# EasyEDA Pro project HEMY-2R-board.epro, board HEMY Redux v2.6.5M
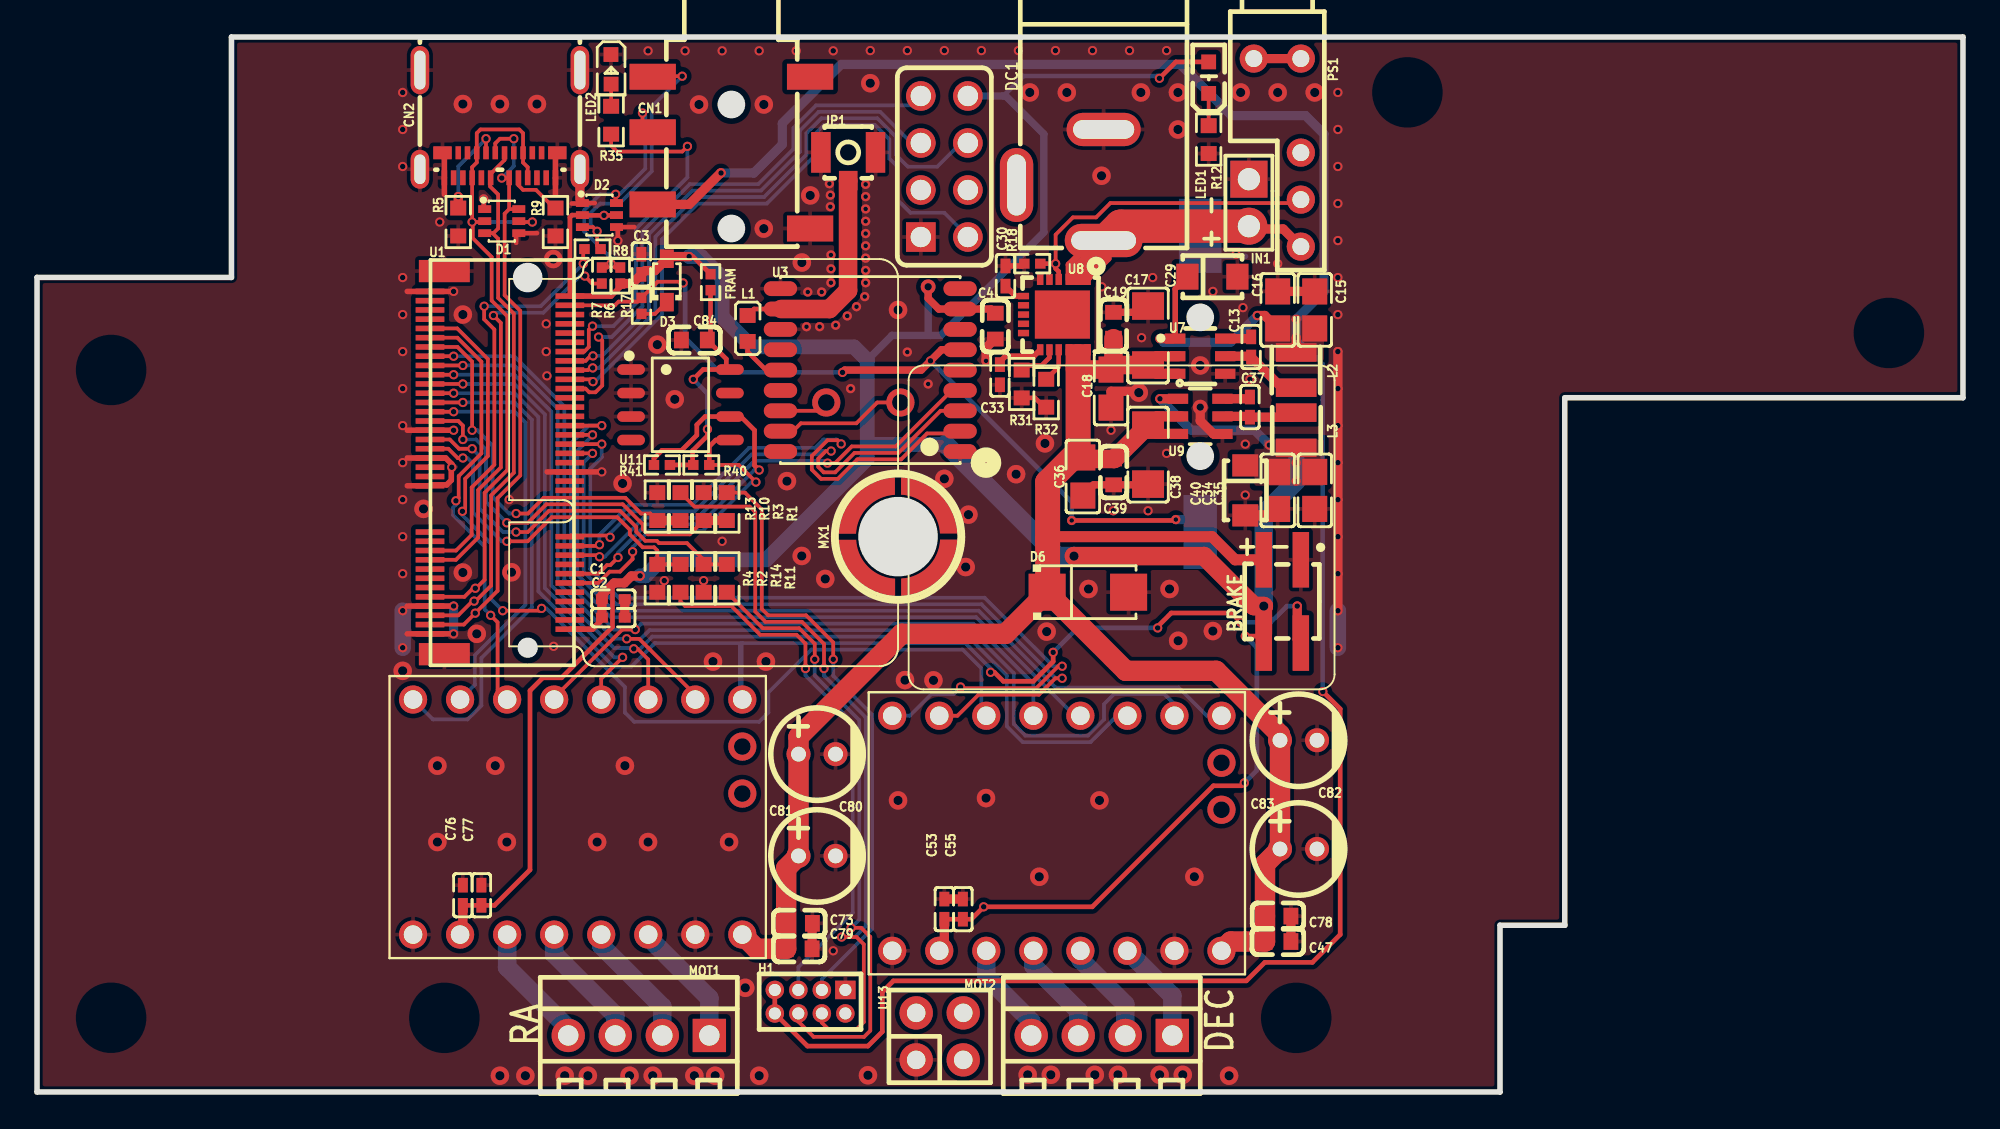
[diagram p7: board, top side]
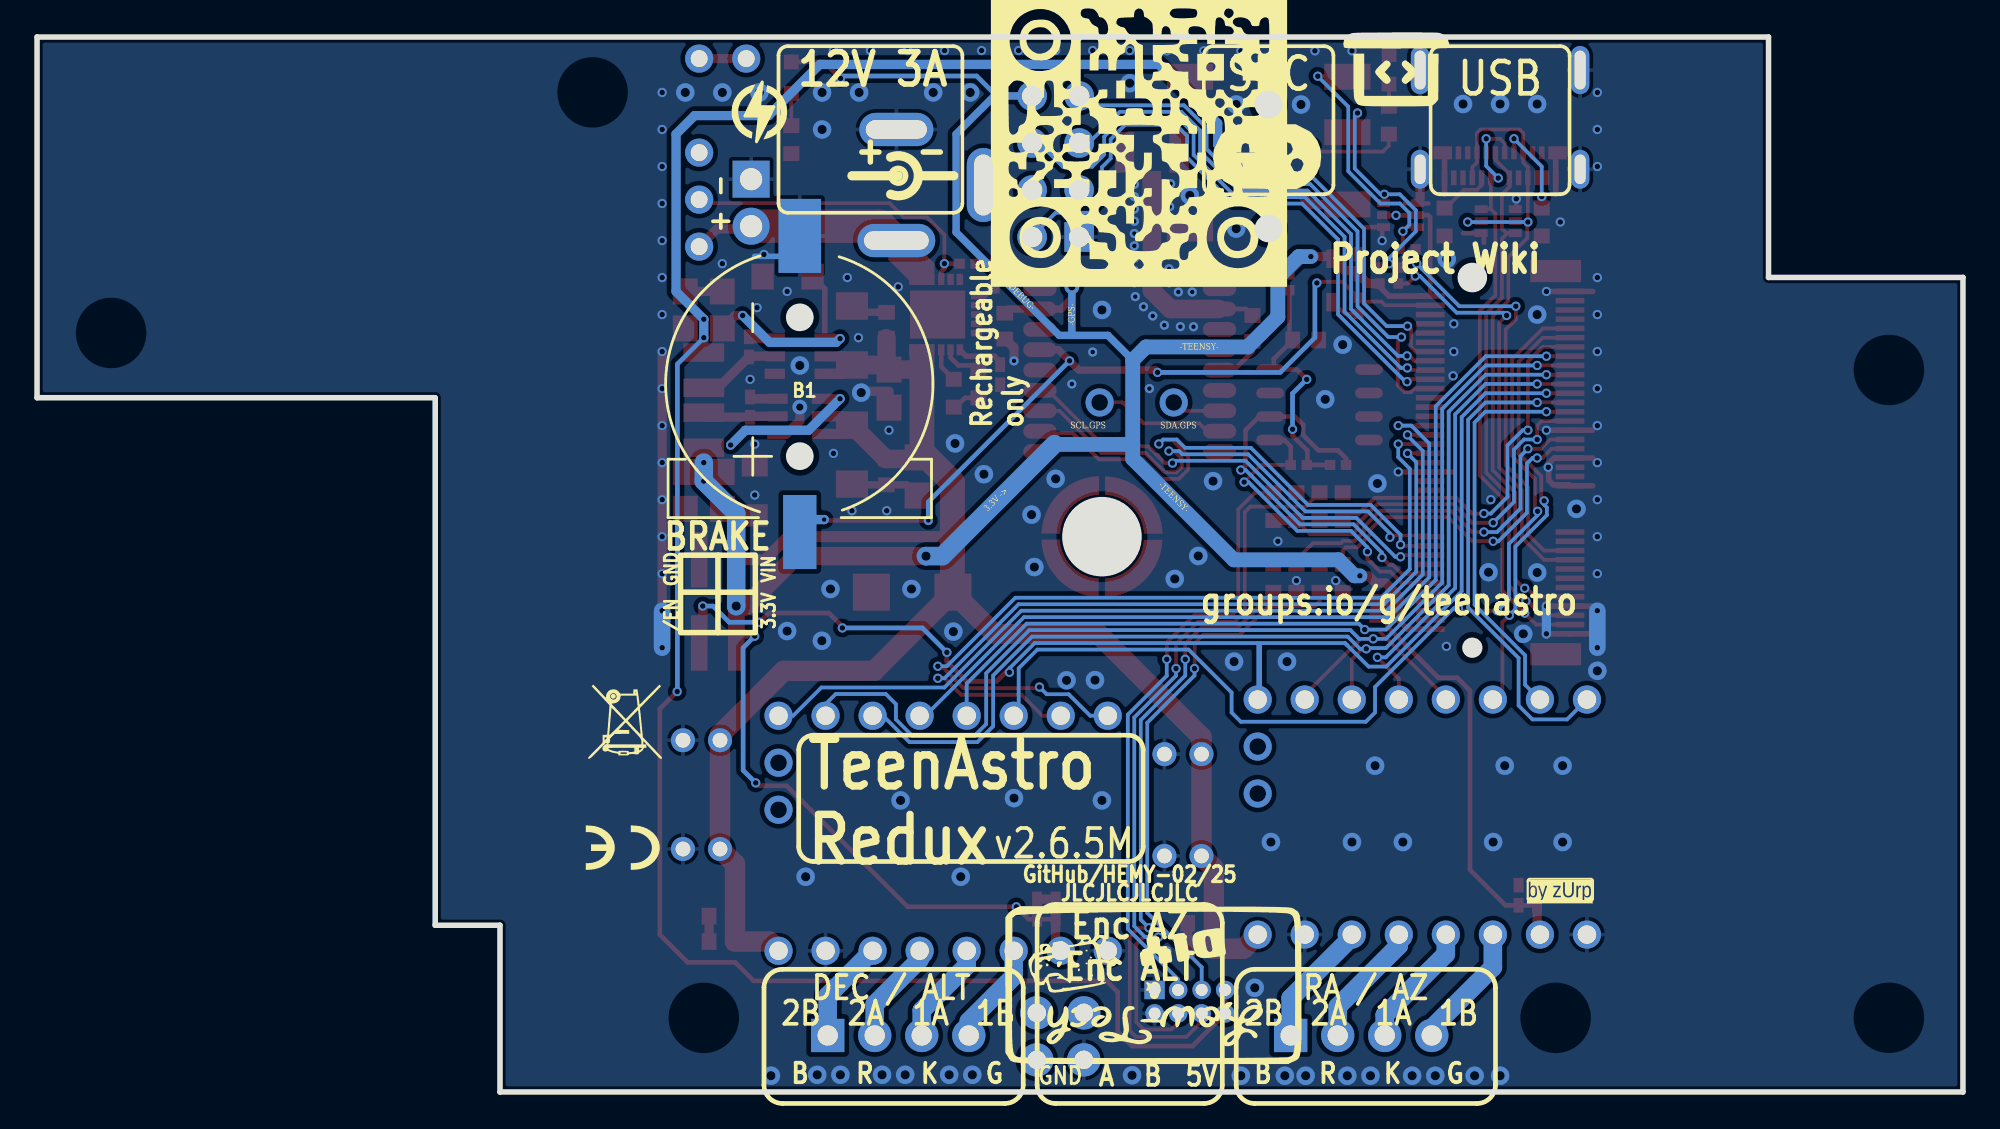
[diagram p8: board, bottom side, seen from below]

Outline 104 x 57 mm; copper layers: Top Layer, Inner_1_GND, Inner_2_GND, Bottom Layer. Coordinates in mm from the lower left corner of the outline.
Outline path: 0,44.01 10.5,44.01 10.5,57 104,57 104,37.51 82.5,37.51 82.5,9.01 79,9.01 79,0 0,0 0,44.01
Stack: Top Layer 0.035mm Outer layer thickness 1oz / Dielectric1 0.48mm 7628 RC49% 8.6mil / Inner_1_GND 0.035mm Inner layer thickness / Dielectric2 0.48mm 1.1mm H/HOZ Copper / Inner_2_GND 0.035mm Inner layer thickness / Dielectric3 0.48mm 7628 RC49% 8.6mil / Bottom Layer 0.035mm Outer layer thickness 1oz

## Design rules (mm)
spacing safeClearance (default): track to track 0.15, other pairs 0 to 0.15
spacing Power: track to track 0.25, other pairs 0 to 0.25
spacing Plane_innerPlane: track to track 0.15, other pairs 0 to 0.15
spacing Copper_copperRegion: track to track 0.15, other pairs 0 to 0.15
spacing Copper_Vcc_stepper: track to track 0.15, other pairs 0 to 0.15
spacing Copper_GND: track to track 0.15, other pairs 0 to 0.15
spacing Copper_Vcc_in: track to track 0.15, other pairs 0 to 0.15
track width trackWidth (default): min 0.15, default 0.25, max 2
track width Power: min 0.25, default 0.5, max 2.5
differential pair differentialPair (default): width min 0.127, default 0.254, max 2.54; gap min 0.152, default 0.152
net VCC uses Copper_Vcc_stepper, Plane_innerPlane_Power, Power
net GND uses Copper_GND, Plane_innerPlane_safeClearance, Power
net VUSB_IN uses Copper_copperRegion_safeClearance, Plane_innerPlane_safeClearance
net D+ uses Copper_copperRegion_safeClearance, Plane_innerPlane_safeClearance
net D- uses Copper_copperRegion_safeClearance, Plane_innerPlane_safeClearance
net +3.3V uses Copper_copperRegion_Power, Plane_innerPlane_Power, Power
net TX_GPS uses Copper_copperRegion_safeClearance, Plane_innerPlane_safeClearance
net RX_GPS uses Copper_copperRegion_safeClearance, Plane_innerPlane_safeClearance
net VBAT uses Copper_copperRegion_safeClearance, Plane_innerPlane_safeClearance
net LED uses Copper_copperRegion_safeClearance, Plane_innerPlane_safeClearance
net M1_STEP uses Copper_copperRegion_safeClearance, Plane_innerPlane_safeClearance
net M1_DIR uses Copper_copperRegion_safeClearance, Plane_innerPlane_safeClearance
net M1_CS uses Copper_copperRegion_safeClearance, Plane_innerPlane_safeClearance
net M1_ENA uses Copper_copperRegion_safeClearance, Plane_innerPlane_safeClearance
net SCK uses Copper_copperRegion_safeClearance, Plane_innerPlane_safeClearance
net M2_CS uses Copper_copperRegion_safeClearance, Plane_innerPlane_safeClearance
net M2_BMB1 uses Copper_copperRegion_Power, Plane_innerPlane_Power, Power
net M2_BMA1 uses Copper_copperRegion_Power, Plane_innerPlane_Power, Power
net M1_BMB1 uses Copper_copperRegion_Power, Plane_innerPlane_Power, Power
net M1_BMA1 uses Copper_copperRegion_Power, Plane_innerPlane_Power, Power
net M2_BMB2 uses Copper_copperRegion_Power, Plane_innerPlane_Power, Power
net M2_BMA2 uses Copper_copperRegion_Power, Plane_innerPlane_Power, Power
net M1_BMB2 uses Copper_copperRegion_Power, Plane_innerPlane_Power, Power
net M1_BMA2 uses Copper_copperRegion_Power, Plane_innerPlane_Power, Power
net RX_REMOTE uses Copper_copperRegion_safeClearance, Plane_innerPlane_safeClearance
net TX_REMOTE uses Copper_copperRegion_safeClearance, Plane_innerPlane_safeClearance
net RX_DEBUG uses Copper_copperRegion_safeClearance, Plane_innerPlane_safeClearance
net TX_DEBUG uses Copper_copperRegion_safeClearance, Plane_innerPlane_safeClearance
net M2_DIR uses Copper_copperRegion_safeClearance, Plane_innerPlane_safeClearance
net M2_STEP uses Copper_copperRegion_safeClearance, Plane_innerPlane_safeClearance
net M2_ENA uses Copper_copperRegion_safeClearance, Plane_innerPlane_safeClearance
net MOSI uses Copper_copperRegion_safeClearance, Plane_innerPlane_safeClearance
net MISO uses Copper_copperRegion_safeClearance, Plane_innerPlane_safeClearance
net $1N74186 uses Copper_copperRegion_safeClearance, Plane_innerPlane_safeClearance
net $1N74185 uses Copper_copperRegion_safeClearance, Plane_innerPlane_safeClearance
net PPS uses Copper_copperRegion_safeClearance, Plane_innerPlane_safeClearance
net $1N92540 uses Copper_copperRegion_safeClearance, Plane_innerPlane_safeClearance
net $1N104749 uses Copper_copperRegion_safeClearance, Plane_innerPlane_safeClearance
net $1N104745 uses Copper_copperRegion_safeClearance, Plane_innerPlane_safeClearance
net $1N106286 uses Copper_copperRegion_safeClearance, Plane_innerPlane_safeClearance
net M1_ENCX uses Copper_copperRegion_safeClearance, Plane_innerPlane_safeClearance
net M1_ENCB uses Copper_copperRegion_safeClearance, Plane_innerPlane_safeClearance
net M2_ENCB uses Copper_copperRegion_safeClearance, Plane_innerPlane_safeClearance
net M1_ENCA uses Copper_copperRegion_safeClearance, Plane_innerPlane_safeClearance
net M2_ENCA uses Copper_copperRegion_safeClearance, Plane_innerPlane_safeClearance
net M2_ENCX uses Copper_copperRegion_safeClearance, Plane_innerPlane_safeClearance
net RST_ESP uses Copper_copperRegion_safeClearance, Plane_innerPlane_safeClearance
net PRG_ESP uses Copper_copperRegion_safeClearance, Plane_innerPlane_safeClearance
net M1_ENCA_IN uses Copper_copperRegion_safeClearance, Plane_innerPlane_safeClearance
net M2_ENCA_IN uses Copper_copperRegion_safeClearance, Plane_innerPlane_safeClearance
net M1_ENCB_IN uses Copper_copperRegion_safeClearance, Plane_innerPlane_safeClearance
net M2_ENCB_IN uses Copper_copperRegion_safeClearance, Plane_innerPlane_safeClearance
net +5V uses Copper_copperRegion_Power, Plane_innerPlane_Power, Power
net $3N2384 uses Copper_copperRegion_safeClearance, Plane_innerPlane_safeClearance
net $3N2780 uses Copper_copperRegion_safeClearance, Plane_innerPlane_safeClearance
net $1N143386 uses Copper_copperRegion_safeClearance, Plane_innerPlane_safeClearance
net $3N23825 uses Copper_copperRegion_safeClearance, Plane_innerPlane_safeClearance
net $3N39869 uses Copper_copperRegion_safeClearance, Plane_innerPlane_safeClearance
net $3N39858 uses Copper_copperRegion_safeClearance, Plane_innerPlane_safeClearance
net $3N39927 uses Copper_copperRegion_safeClearance, Plane_innerPlane_safeClearance
net $3N39977 uses Copper_copperRegion_safeClearance, Plane_innerPlane_safeClearance
net $3N40264 uses Copper_copperRegion_safeClearance, Plane_innerPlane_safeClearance
net $3N40420 uses Copper_copperRegion_safeClearance, Plane_innerPlane_safeClearance
net $3N40219 uses Copper_copperRegion_safeClearance, Plane_innerPlane_safeClearance
net $3N44065 uses Copper_copperRegion_safeClearance, Plane_innerPlane_safeClearance
net $3N44061 uses Copper_copperRegion_safeClearance, Plane_innerPlane_safeClearance
net $1N106279 uses Copper_copperRegion_safeClearance, Plane_innerPlane_safeClearance
net SDA uses Copper_copperRegion_safeClearance, Plane_innerPlane_safeClearance
net SCL uses Copper_copperRegion_safeClearance, Plane_innerPlane_safeClearance
net $1N173382 uses Copper_copperRegion_safeClearance, Plane_innerPlane_safeClearance
net M2_M4 uses Copper_copperRegion_safeClearance, Plane_innerPlane_safeClearance
net M1_M4 uses Copper_copperRegion_safeClearance, Plane_innerPlane_safeClearance
net SCLG uses Copper_copperRegion_safeClearance, Plane_innerPlane_safeClearance
net SDAG uses Copper_copperRegion_safeClearance, Plane_innerPlane_safeClearance
pour e1414 uses Copper_copperRegion, copperRegion_Copper_copperRegion
pour e1416 uses Copper_copperRegion, copperRegion_Copper_copperRegion
pour e1418 uses Copper_GND, copperRegion_Copper_GND
pour e1486 uses Copper_GND, copperRegion_Copper_GND
pour e1553 uses Copper_GND, copperRegion_Copper_GND
pour e1627 uses Copper_GND, copperRegion_Copper_GND

## Placement (name value [footprint] x y rotation side)
B1  ML1220  [bat-smd_cr1220-2]  62.81 38.25 90 bottom
BRAKE  X4621WVS-2x02I-C40D64  [HDR-SMD_4P-P2.00-V-M-R2-C2-S2.0]  67.25 26.5 180 top
C1  1uF  [C0402]  31.12 26.63 180 top
C2  100nF  [C0402]  31.12 25.63 180 top
C3  100nF  [C0402#2]  32.63 44.72 90 top
C4  10uF  [C0603]  51.75 41.38 270 top
C13  100nF  [C0402#2]  65.56 40.25 270 top
C15  10uF  [C0805]  69 42.25 270 top
C16  10uF  [C0805]  67 42.25 270 top
C17  10uF  [C1206]  60 40.87 270 top
C18  1uF  [C0805#2]  58 38 90 top
C19  100nF  [C0603]  58.13 41.43 270 top
C29  47uF  [CAP-SMD_L3.2-W1.6]  63.47 44.05 0 top
C30  100nF  [C0402#2]  52.3 44.09 270 top
C33  10nF  [C0402#2]  52 38.75 270 top
C34  10uF  [C0805]  67 32.5 90 top
C35  10uF  [C0805]  69 32.5 90 top
C36  1uF  [C0805#2]  56.47 33.25 90 top
C37  100nF  [C0402#2]  65.5 37 270 top
C38  10uF  [C1206]  60 34.44 90 top
C39  100nF  [C0603]  58.14 33.5 90 top
C40  47uF  [CAP-SMD_L3.2-W1.6]  65.25 32.5 270 top
C47  100nF  [C0603]  67.01 8.13 0 top
C53  100nF  [C0402#2]  49 9.88 90 top
C55  1uF  [C0402#2]  50 9.88 270 top
C73  100nF  [C0603]  41.17 9.11 0 top
C76  100nF  [C0402#2]  23 10.63 90 top
C77  1uF  [C0402#2]  24 10.63 270 top
C78  1uF  [C0603]  67.01 9.5 180 top
C79  1uF  [C0603]  41.15 7.74 180 top
C80  100uF  [CAP-TH_BD5.0-P2.00-D0.8-FD]  42.12 18.25 0 top
C81  100uF  [CAP-TH_BD5.0-P2.00-D0.8-FD]  42.12 12.75 0 top
C82  100uF  [CAP-TH_BD5.0-P2.00-D0.8-FD]  68.12 19 0 top
C83  100uF  [CAP-TH_BD5.0-P2.00-D0.8-FD]  68.12 13.13 0 top
C84  10uF  [C0603]  35.5 40.63 180 top
CN1  PJ-327E-SMT  [AUDIO-SMD_PJ-327E-SMT]  37.5 50.75 180 top
CN2  USB_C  [USB-C-SMD_TYPE-C-USB-18]  25 52.3 180 top
D1  BAV99S,115  [SOT-363_L2.0-W1.3-P0.65-LS2.1-TL]  25.09 47.05 0 top
D2  BAV99S,115  [SOT-363_L2.0-W1.3-P0.65-LS2.1-TL]  30.37 47.38 0 top
D3  1N5819WS  [SOD-323_L1.8-W1.3-LS2.5-RD]  34.01 43.85 90 top
D6  SS34  [SMA_L4.3-W2.6-LS5.2-RD]  56.75 27 0 top
DC1  DC-005-5A-2.0  [DC-IN-TH_DC-005-5A-2.0]  55.25 49 270 top
DEC_TMC  ?  [TMC2130 STEPPER MOTOR DRIVER CARRIER]  55.07 13.98 270 top
FRAM  0Ω  [R0402]  36.37 43.75 90 top
H1  DW127R-22-08-34  [HDR-TH_8P-P1.27-V-F-R2-C4-S1.27]  41.75 4.88 180 top
H2  Debug  [HDR-TH_8P-P2.54-V-F-R2-C4-S2.54]  49 50 270 top
IN1  HEAD2  [HDR-TH_2P-P2.54-V-M]  65.44 48.05 270 top
JP1  BWU.FL-IPEX1  [IPEX-SMD_BWIPX-1-001E]  43.8 50 90 top
L1  47nH  [IND-SMD_L1.6-W0.8-1]  38.37 41.25 270 top
L2  10uH  [IND-SMD_L2.5-W2.0_SWPA252012S]  68 39 90 top
L3  10uH  [IND-SMD_L2.5-W2.0_SWPA252012S]  68 35.75 270 top
LED1  KT-0603W  [LED0603-R-RD_WHITE]  63.27 54.8 90 top
LED2  KT-0603R  [LED0603-RD]  31 55.25 270 top
MOT1  DB125-2.54-4P-GN-S  [CONN-TH_DB125-2.54-4P-GN]  32.5 3.05 180 top
MOT2  DB125-2.54-4P-GN-S  [CONN-TH_DB125-2.54-4P-GN]  57.5 3.05 180 top
MX1  Plot M.2  [SMD_BD5.6-D4.1]  46.5 30 0 top
PS1  -  [Power_switch]  68.25 50.75 180 top
R1  1.5kΩ  [R0603]  37.25 31.63 270 top
R2  1.5kΩ  [R0603]  34.75 27.75 90 top
R3  3kΩ  [R0603]  36 31.63 90 top
R4  3kΩ  [R0603]  33.5 27.75 270 top
R5  5.1kΩ  [R0603]  22.75 47 90 top
R6  10kΩ  [R0402]  31.5 44.11 90 top
R7  22Ω  [R0402]  30.5 44.11 90 top
R8  22Ω  [R0402]  30 45.54 0 top
R9  5.1kΩ  [R0603]  28 47 270 top
R10  1.5kΩ  [R0603]  34.75 31.63 270 top
R11  1.5kΩ  [R0603]  37.25 27.75 90 top
R12  150Ω  [R0603]  63.27 51.46 270 top
R13  3kΩ  [R0603]  33.5 31.63 90 top
R14  3kΩ  [R0603]  36 27.75 270 top
R17  1kΩ  [R0402]  32.64 42.48 90 top
R18  10kΩ  [R0402]  53.75 44.75 0 top
R31  33kΩ  [R0603]  53.17 38.25 90 top
R32  240kΩ  [R0603]  54.5 37.75 90 top
R35  150Ω  [R0603]  31 52.5 90 top
R40  10kΩ  [R0402]  35.87 33.88 0 top
R41  10kΩ  [R0402]  33.75 33.88 0 top
RA_TMC  ?  [TMC2130 STEPPER MOTOR DRIVER CARRIER]  29.19 14.85 270 top
U1  MICROMOD-Teensy4  [M.2-CONNECTOR-E]  26.5 34 270 top
U3  ATGM336H-6N-74  [COMM-SMD_18P-L10.1-W9.7-P1.1-TL_L76-LB]  45 39 180 top
U7  AP63205WU-7  [TSOT-23-6_L2.9-W1.6-P0.95-LS2.8-BL]  62.81 39.75 270 top
U8  DPS1135FIA-13  [QFN-17_L4.0-W4.0-P0.50-TL-EP]  55 42 270 top
U9  AP63203WU-7  [TSOT-26_L2.9-W1.6-P0.95-LS2.8-BL]  62.81 36.5 270 top
U11  MB85RC64TAPNF-G-BDERE1  [SOP-8_L5.0-W4.0-P1.27-LS6.0-BL]  34.75 37.13 270 top
U13  2.54-2*2  [HDR-TH_4P-P2.54-V-F-R2-C2-S2.54]  48.75 3 0 top

## Footprints (pads in the part's own frame, mm; a bottom-side part is the same pattern mirrored in y, then rotated)
AUDIO-SMD_PJ-327E-SMT
  rect 2.5x1.4 smd: 1(-4.25,4.1) 2(4.25,-4.1) 3(4.25,-1.1) 4(4.25,2.8) 5(-4.25,-4.1)
bat-smd_cr1220-2
  rect 4x1.8 smd: 1(-8,0)
  rect 4x2.3 smd: 2(8,0)
C0402
  rect 0.645x0.54 smd: 1(-0.618,0) 2(0.618,0)
C0402#2
  rect 0.79x0.54 smd: 1(-0.545,0) 2(0.545,0)
C0603
  rect 0.8x0.9 smd: 1(-0.7,0) 2(0.7,0)
C0805
  rect 1.41x1.35 smd: 1(-1,0) 2(1,0)
C0805#2
  rect 1.41x1.35 smd: 1(-1.03,0) 2(1.03,0)
C1206
  rect 1.485x1.728 smd: 1(-1.593,0) 2(1.593,0)
CAP-SMD_L3.2-W1.6
  rect 1.2x1.4 smd: 1(-1.35,0) 2(1.35,0)
CAP-TH_BD5.0-P2.00-D0.8-FD
  round 1.3 hole 0.8: 1(-1,0) 2(1,0)
COMM-SMD_18P-L10.1-W9.7-P1.1-TL_L76-LB
  custom 1.8x0.8 smd: 1(-4.85,4.4) 2(-4.85,3.3) 3(-4.85,2.2) 4(-4.85,1.1) 5(-4.85,0) 6(-4.85,-1.1) 7(-4.85,-2.2) 8(-4.85,-3.3) 9(-4.85,-4.4) 10(4.85,-4.4) 11(4.85,-3.3) 12(4.85,-2.2) 13(4.85,-1.1) 14(4.85,0) 15(4.85,1.1) 16(4.85,2.2) 17(4.85,3.3) 18(4.85,4.4)
CONN-TH_DB125-2.54-4P-GN
  rect 1.8x1.8 hole 1.1: 1(-3.81,0)
  round 1.8 hole 1.1: 2(-1.27,0) 3(1.27,0) 4(3.81,0)
DC-IN-TH_DC-005-5A-2.0
  oval 1.8x4.2 hole 1x3.5: 1(3,2.352)
  oval 1.8x4 hole 1x3.3: 2(-3,2.352)
  oval 4x1.8 hole 3.3x1: 3(-0.001,-2.352)
HDR-SMD_4P-P2.00-V-M-R2-C2-S2.0
  rect 0.89x3 smd: 1(-1,-2.25) 2(-1,2.25) 3(1,-2.25) 4(1,2.25)
HDR-TH_2P-P2.54-V-M
  rect 2x2 hole 1.2: 1(-1.27,0)
  round 2 hole 1.2: 2(1.27,0)
HDR-TH_4P-P2.54-V-F-R2-C2-S2.54
  round 1.8 hole 1: 1(-1.27,-1.27) 2(-1.27,1.27) 3(1.27,-1.27) 4(1.27,1.27)
HDR-TH_8P-P1.27-V-F-R2-C4-S1.27
  rect 1.1x1 hole 0.65: 1(-1.905,-0.635)
  round 1 hole 0.65: 2(-1.905,0.635) 3(-0.635,-0.635) 4(-0.635,0.635) 5(0.635,-0.635) 6(0.635,0.635) 7(1.905,-0.635) 8(1.905,0.635)
HDR-TH_8P-P2.54-V-F-R2-C4-S2.54
  round 1.6 hole 1.1: 1(-3.81,-1.27) 2(-3.81,1.27) 3(-1.27,-1.27) 4(-1.27,1.27) 5(1.27,-1.27) 6(1.27,1.27) 8(3.81,1.27)
  rect 1.6x1.6 hole 1.1: 7(3.81,-1.27)
IND-SMD_L1.6-W0.8-1
  rect 0.8x0.864 smd: 1(0.7,0) 2(-0.7,0)
IND-SMD_L2.5-W2.0_SWPA252012S
  rect 1x2.2 smd: 1(-0.951,0) 2(0.951,0)
IPEX-SMD_BWIPX-1-001E
  rect 1.05x1 smd: 1(-0.762,0)
  rect 2.2x1.05 smd: 2(0.762,-1.475) 3(0.762,1.475)
LED0603-R-RD_WHITE
  rect 0.8x0.8 smd: 1(0.851,0) 2(-0.851,0)
LED0603-RD
  rect 0.8x0.8 smd: 1(-0.799,-0.004) 2(0.799,0.004)
M.2-CONNECTOR-E
  custom 0.3x1.55 smd: 1(9.25,-5.275) 2(9,2.275) 3(8.75,-5.275) 4(8.5,2.275) 5(8.25,-5.275) 6(8,2.275) 7(7.75,-5.275) 8(7.5,2.275) 9(7.25,-5.275) 10(7,2.275) 11(6.75,-5.275) 12(6.5,2.275) 13(6.25,-5.275) 14(6,2.275) 15(5.75,-5.275) 16(5.5,2.275) 17(5.25,-5.275) 18(5,2.275) 19(4.75,-5.275) 20(4.5,2.275) 21(4.25,-5.275) 22(4,2.275) 23(3.75,-5.275) 32(1.5,2.275) 33(1.25,-5.275) 34(1,2.275) 35(0.75,-5.275) 36(0.5,2.275) 37(0.25,-5.275) 38(0,2.275) 39(-0.25,-5.275) 40(-0.5,2.275) 41(-0.75,-5.275) 42(-1,2.275) 43(-1.25,-5.275) 44(-1.5,2.275) 45(-1.75,-5.275) 46(-2,2.275) 47(-2.25,-5.275) 48(-2.5,2.275) 49(-2.75,-5.275) 50(-3,2.275) 51(-3.25,-5.275) 52(-3.5,2.275) 53(-3.75,-5.275) 54(-4,2.275) 55(-4.25,-5.275) 56(-4.5,2.275) 57(-4.75,-5.275) 58(-5,2.275) 59(-5.25,-5.275) 60(-5.5,2.275) 61(-5.75,-5.275) 62(-6,2.275) 63(-6.25,-5.275) 64(-6.5,2.275) 65(-6.75,-5.275) 66(-7,2.275) 67(-7.25,-5.275) 68(-7.5,2.275) 69(-7.75,-5.275) 70(-8,2.275) 71(-8.25,-5.275) 72(-8.5,2.275) 73(-8.75,-5.275) 74(-9,2.275) 75(-9.25,-5.275)
  custom 1.2x2.75 smd: 1(10.35,-4.5) 75(-10.35,-4.5)
Power_switch
  round 1.524 hole 0.914: 1(0,-5.08) 2(2.54,-5.08) 4(0,5.08) 5(0,2.54) 6(0,0)
QFN-17_L4.0-W4.0-P0.50-TL-EP
  rect 0.6x0.35 smd: 1(-1.9,1.726) 2(-1.9,1.226) 3(-1.9,0.726) 4(-1.9,0.175) 5(-1.9,-0.326) 6(-1.9,-0.826) 12(1.9,-0.826) 13(1.9,-0.326) 14(1.9,0.175) 15(1.9,0.726) 16(1.9,1.226) 17(1.9,1.726)
  rect 0.6x1.35 smd: 1(-1.9,1.225) 17(1.9,1.224)
  rect 0.35x0.6 smd: 7(-1,-1.726) 8(-0.5,-1.726) 9(0,-1.726) 10(0.5,-1.726) 11(1,-1.726)
  rect 2.6x2.975 smd: 18(0,0.374)
R0402
  rect 0.566x0.54 smd: 1(-0.433,0) 2(0.433,0)
R0603
  rect 0.806x0.864 smd: 1(-0.753,0) 2(0.753,0)
SMA_L4.3-W2.6-LS5.2-RD
  rect 2x2 smd: 1(-2.2,0) 2(2.2,0)
SMD_BD5.6-D4.1
  custom 3.1x3.1 smd: 1(-2.17,1.71) 1(-1.71,-2.17) 1(1.71,2.17) 1(2.17,-1.71)
SOD-323_L1.8-W1.3-LS2.5-RD
  rect 1x0.75 smd: 1(-1.173,0) 2(1.173,0)
SOP-8_L5.0-W4.0-P1.27-LS6.0-BL
  oval 0.574x1.5 smd: 1(-1.905,-2.668) 2(-0.635,-2.668) 3(0.635,-2.668) 4(1.905,-2.668) 5(1.905,2.668) 6(0.635,2.668) 7(-0.635,2.668) 8(-1.905,2.668)
SOT-363_L2.0-W1.3-P0.65-LS2.1-TL
  rect 0.7x0.42 smd: 1(-0.92,0.65) 2(-0.92,0) 3(-0.92,-0.65) 4(0.92,-0.65) 5(0.92,0) 6(0.92,0.65)
TMC2130 STEPPER MOTOR DRIVER CARRIER
  round 1.524 hole 1x0.9: 1(-6.35,8.89) 2(-6.35,6.35) 3(-6.35,3.81) 4(-6.35,1.27) 5(-6.35,-1.27) 6(-6.35,-3.81) 7(-6.35,-6.35) 8(-6.35,-8.89) 9(6.35,-8.89) 10(6.35,-6.35) 11(6.35,-3.81) 12(6.35,-1.27) 13(6.35,1.27) 14(6.35,3.81) 15(6.35,6.35) 16(6.35,8.89)
TSOT-23-6_L2.9-W1.6-P0.95-LS2.8-BL
  rect 0.55x1.1 smd: 1(-0.95,-1.35) 2(0,-1.35) 3(0.95,-1.35) 4(0.95,1.35) 5(0,1.35) 6(-0.95,1.35)
TSOT-26_L2.9-W1.6-P0.95-LS2.8-BL
  rect 0.55x1.1 smd: 1(-0.95,-1.2) 2(0,-1.2) 3(0.95,-1.2) 4(0.95,1.2) 5(0,1.2) 6(-0.95,1.2)
USB-C-SMD_TYPE-C-USB-18
  oval 1x2.1 hole 0.6x1.6: 0(-4.32,2.45) 0(4.32,2.45)
  oval 1x2.6 hole 0.6x2.1: 0(-4.32,-2.91) 0(4.32,-2.91)
  rect 0.3x0.8 smd: A1(-3,2.91) A2(-2.5,2.91) A3(-2,2.91) A4(-1.5,2.91) A5(-1,2.91) A6(-0.5,2.91) A7(0.5,2.91) A8(1,2.91) A9(1.5,2.91) A10(2,2.91) A11(2.5,2.91) A12(3,2.91)
  rect 1x0.7 smd: B1(3.1,1.56)
  rect 0.3x0.7 smd: B2(2.25,1.56) B3(1.75,1.56) B4(1.25,1.56) B5(0.75,1.56) B6(0.25,1.56) B7(-0.25,1.56) B8(-0.75,1.56) B9(-1.25,1.56) B10(-1.75,1.56) B11(-2.25,1.56)
  custom 1x0.7 smd: B12(-3.1,1.56)

## Nets
As in the schematic, except:
+3.3V: BRAKE.4 C1.2 C2.2 C3.1 C4.1 C34.2 C35.2 C40.1 C53.1 C55.2 C76.1 C77.2 D2.2 D2.5 D3.2 DEC_TMC.10 FRAM.2 H2.2 L3.2 LED1.1 R6.1 RA_TMC.10 U1.2 U1.74 U3.8 U9.1
GND: B1.2 BRAKE.1 C1.1 C2.1 C3.2 C4.2 C15.1 C16.1 C17.1 C18.1 C19.1 C29.2 C30.1 C33.2 C34.1 C35.1 C36.1 C38.1 C39.1 C40.2 C47.2 C53.2 C55.1 C73.2 C76.2 C77.1 C78.1 C79.1 C80.2 C81.2 C82.2 C83.2 C84.2 CN1.1 CN2.0 CN2.A1 CN2.A12 CN2.B1 CN2.B12 D1.1 D1.4 D2.1 D2.4 D6.2 DC1.2 DEC_TMC.9 DEC_TMC.15 H1.1 H1.2 H2.7 IN1.1 JP1.2 JP1.3 LED2.1 MX1.1 R3.2 R4.2 R5.1 R9.2 R12.2 R13.2 R14.2 R18.1 R31.1 R32.1 RA_TMC.9 RA_TMC.15 U1.1 U1.7 U1.33 U1.36 U1.39 U1.45 U1.75 U3.1 U3.10 U3.12 U7.4 U8.6 U9.4 U11.1 U11.2 U11.3 U13.1
VCC: BRAKE.3 C17.2 C18.2 C19.2 C36.2 C38.2 C39.2 C47.1 C73.1 C78.2 C79.2 C80.1 C81.1 C82.1 C83.1 D6.1 DEC_TMC.16 RA_TMC.16 U7.2 U7.3 U8.15 U8.16 U8.17 U9.2 U9.3
M1_ENA: BRAKE.2 RA_TMC.1 U1.53
PPS: U1.18 U3.4
SCL: R41.1 U1.14 U11.6
SDA: R40.2 U1.12 U11.5

Pads without a net: CN1 5; CN2 A2 A3 A8 A10 A11 B2 B3 B8 B10 B11; DC1 3; H2 5 6; PS1 6; U1 4 6 8 11 13 15 16 21 23 34 35 37 38 48 50 52 64 66 68 69 70 71 73; U3 5 7 9 13 15 18; U8 5 8 9 10 11 18; U11 4 7

## Via types
v1: diameter 1.524, hole 0.9, Top Layer to Bottom Layer, 6 vias
v2: diameter 0.5, hole 0.3, Top Layer to Bottom Layer, 176 vias
v3: diameter 1, hole 0.5, Top Layer to Bottom Layer, 81 vias
v4: diameter 0.8, hole 0.4, Top Layer to Bottom Layer, 2 vias
v5: diameter 0.5, hole 0.25, Top Layer to Bottom Layer, 29 vias

## Routing (per net, layer and track width the routed paths; a pad name or vN(x,y) marks a point on that pad's centre or on a via; arc(x,y) is an arc through that point)
+3.3V: length 194.4
  Top Layer w0.25: v2(60.61,54.77) 61.5,55.65 LED1.1 ; v2(65.19,16.7) 65.04,16.54 63.52,16.54 56.98,10 v2(51.12,10) 50.45,9.33 C55.2 C53.1 ; v2(65.25,24.63) 65.87,24.63 BRAKE.4 ; v2(35.21,45.14) 35.42,45.14 FRAM.2 ; D2.5 31.27,47.36 v2(30.61,47.36) 29.47,47.36 D2.2 28.89,47.38 28.78,47.26 28.78,43 ; C76.1 C77.2 24.7,10.08 26.62,12 26.62,21.69 27.31,22.38 28.32,22.38 31.07,25.13 31.07,27.25
  Top Layer w0.3: U1.74 31,43 31.5,43.5 R6.1 ; U1.2 30,25 30.5,25.51 C2.2
  Top Layer w0.4: C4.1 51.52,42.3 U3.8 48.7,42.3 48.12,42.88 v4(48.12,43.5)
  Top Layer w0.5: C76.1 23,8.65 RA_TMC.10 ; R6.1 32.14,43.68 C3.1 32.84,44.38 33.37,44.38 D3.2 34.12,45.14 v2(35.21,45.14) ; 61.8,37.45 v2(60.64,37.45) ; C2.2 C1.2 30.5,26.85 31.16,27.5 31.72,27.5 32.09,27.88 32.56,27.88 v2(32.56,27.89) ; C53.1 49,7.9 DEC_TMC.10
  Top Layer w0.9: v3(66.25,26.25) 66.25,24.75
  Top Layer w1: v3(56,28.95) 63.01,28.95 65.71,26.25 v3(66.25,26.25)
  Bottom Layer w0.25: 52.18,53.81 53.26,54.89 60.5,54.89 60.61,54.78 v2(60.61,54.77) ; v2(65.19,16.7) 65.87,17.38 65.87,24 v2(65.25,24.63)
  Bottom Layer w0.4: 48.23,40.88 46.17,40.88 44.83,39.54 ; 48.23,40.88 48.12,40.99 v4(48.12,43.5) ; 48.23,40.88 48.8,40.88 54.37,46.45 54.37,51.75 52.31,53.81 50.26,53.81
  Bottom Layer w0.5: v2(66.55,34.95) 65.75,35.75 62.34,35.75 v2(60.64,37.45)
  Bottom Layer w0.8: 44.83,34.99 49.04,34.99 49.06,35 ; 44.83,34.99 44.83,34.22 39.37,28.75 33.72,28.75 32.86,27.89 v2(32.56,27.89) ; 44.83,34.99 44.83,39.54 44.12,40.25 38.62,40.25 37,41.88 37,44 35.86,45.14 v2(35.21,45.14)
  Bottom Layer w1: 49.06,35 55.11,28.95 v3(56,28.95) ; v2(68,34) v2(68,33) 66.25,31.25 v3(66.25,26.25)
+5V: length 135.2
  Top Layer w0.25: H1.7 H1.8 41.6,2.48 44.87,2.48 45.65,3.26 45.65,5.4 46.25,6 65.3,6 66.3,7 68.87,7 70.37,8.5 70.37,20.7 v2(69.43,21.64)
  Top Layer w0.3: C29.1 61.46,43.39 U7.1
  Top Layer w0.5: v2(68,40.75) L2.2 ; 61.4,40.7 60.65,40.7 ; v2(65.9,41.95) 66.29,41.95 C16.2 ; v2(36.94,49.65) 36.91,49.65 35.21,47.95 CN1.4
  Bottom Layer w0.25: v2(68,40.75) 69.42,39.33 69.42,21.64 v2(69.43,21.64)
  Bottom Layer w0.5: v2(65.9,41.95) 64.44,40.5 60.84,40.5 60.65,40.7 ; v2(68,40.75) v2(68,41.75) 69.5,43.25 69.5,51.75 68.5,52.75 64.5,52.75 61.73,55.52 43.43,55.52 40.25,52.34 40.25,51.2 38.7,49.65 v2(36.94,49.65)
  vias: v2(60.64,40.7)
GND: length 74.7
  Top Layer w0.25: v2(24.12,48.25) 24.12,47.76 24.17,47.7 ; 32.25,46.73 31.29,46.73 31.36,46.66 v2(31.36,46) ; 30.12,48.03 D2.1 29.43,48 28.87,48 ; 25.87,45.88 25.87,46.26 D1.4 27,46.4 ; 53.17,37.5 53.89,37.5 54.39,37 54.5,37
  Top Layer w0.3: v2(30.5,33.5) U1.36 27.55,33.5 ; R18.1 53.19,44.63 C30.1 ; 22,48.5 CN2.A12 22,50.64 CN2.B1 ; 28,48.5 CN2.A1 28,50.64 CN2.B12 ; 20,24.75 U1.1 v2(22.5,24.75) ; 20,35.75 U1.45 v2(22.5,35.75) ; v2(22.5,43.25) U1.75 20,43.25 ; 20,32.75 U1.33 21.27,32.8 22.12,32.8 22.37,33.06 22.37,33.75 v2(22.39,33.75) 22.39,33.93 22.07,34.25 U1.39 20,34.25 ; v2(22.5,26.25) U1.7 20,26.25
  Top Layer w0.4: C36.1 57.05,32.8 C39.1 59.89,32.8 60,32.91 ; C19.1 59.77,42.13 60,42.35
  Top Layer w0.5: v5(51.25,39.5) 51.25,40.21 51.71,40.68 C4.2 ; C73.2 41.85,9.1 C79.1 ; v4(62.81,37) 62.81,36.26 63.52,35.55 64.19,35.55 ; CN2.0 29.31,48.25 ; C53.2 C55.1 ; C16.1 C15.1 ; v3(59.5,37.79) 59.42,37.86 58,37.86 C18.1 ; v2(70.25,40) v2(70.25,38) v2(70.25,36) v2(70.25,34) v2(70.25,32) v2(70.25,30) v2(70.25,28) v2(70.25,26) ; C2.1 C1.1 ; C78.1 C47.2
  Top Layer w0.55: C34.1 66.65,31.15 C40.2
  Bottom Layer w0.3: 63.49,45.15 65.25,45.15
  Bottom Layer w0.5: v2(22.5,24.75) v2(22.5,26.25)
  Bottom Layer w0.894: v2(70.25,24) v2(70.25,26) ; v2(19.75,26) v2(19.75,24)
  vias: v2(19.75,54) v2(19.75,52) v2(19.75,50) v2(19.75,44) v2(19.75,42) v2(19.75,40) v2(19.75,38) v2(19.75,36) v2(19.75,34) v2(19.75,32) v2(19.75,30) v2(19.75,28) v2(21.75,47) v2(25.5,32) v2(27.5,41.5) v2(27.5,40) v2(27.53,38.69) v2(27.89,24.08) v2(33,56.25) v2(33.87,27.63) v2(35,56.25) v2(36,27.63) v2(37,56.25) v2(37,29.75) v2(39,56.25) v2(41,56.25) v2(43,56.25) v2(43,7.63) v2(45,56.27) v2(47,56.27) v2(49,56.27) v2(51,56.27) v2(53,56.27) v2(55,56.27) v2(57,56.27) v2(57.5,43.5) v2(58,35.75) v2(58.12,31.4) v2(59,56.27) v2(59.65,40.75) v2(60,31.4) v2(60.25,44) v2(61,56.27) v2(61,34.5) v2(63.5,43.25) v2(64.75,45.25) v2(65.12,42.38) v2(65.25,35) v2(65.25,32.25) v2(65.5,38.5) v2(67,44.75) v2(70.25,54) v2(70.25,52) v2(70.25,50) v2(70.25,48) v2(70.25,46) v2(70.25,44) v2(70.25,42) v3(19.75,22.75) v3(20.87,31.5) v3(21.62,17.63) v3(21.62,13.5) v3(23,53.38) v3(23,42) v3(22.99,28.07) v3(23.75,24.75) v3(24.75,17.63) v3(25,53.38) v3(25,0.88) v3(25.37,13.5) v3(25.62,28.08) v3(26.37,0.88) v3(27,53.38) v3(27.88,45) v3(28.5,0.88) v3(29.75,0.88) v3(30.25,13.5) v3(31.62,32.88) v3(31.75,17.63) v3(32,0.88) v3(33,13.5) v3(33.25,0.88) v3(33.5,40.38) v3(34.44,37.43) v3(35.5,0.88) v3(35.75,53.35) v3(36.5,23.25) v3(36.62,0.88) v3(37.37,13.5) v3(38.25,5.63) v3(39,0.88) v3(39.25,53.35) v3(39.25,46.65) v3(39.36,23.25) v3(40.5,33) v3(41.3,44.82) v3(41.29,28.96) v3(41.75,48.44) v3(42.56,27.72) v3(44.87,0.9) v3(45,54.5) v3(46.5,42.25) v3(46.5,15.75) v3(46.87,22.25) v3(48.41,22.24) v3(49,33.13) v3(50.15,28.36) v3(50.3,31.19) v3(51.25,15.88) v3(52.87,33.38) v3(53.5,0.93) v3(53.61,54) v3(54.12,11.63) v3(54.43,35.04) v3(54.52,24.87) v3(54.75,0.93) v3(55.61,54) v3(56.78,27.18) v3(57.12,0.93) v3(57.37,15.75) v3(57.48,49.5) v3(58.37,0.93) v3(59.61,54) v3(60.62,0.93) v3(61.16,27.18) v3(61.61,54) v3(61.61,52) v3(61.62,24.38) v3(61.87,0.93) v3(62.5,11.63) v3(62.81,39.25) v3(63.5,24.9) v3(64.37,0.88) v3(65,54) v3(67,54) v3(69,54) v5(41.55,41.35) v5(41.62,43.22) v5(42.26,41.35) v5(42.37,43.22) v5(42.79,49.07) v5(42.84,48.46) v5(42.84,47.83) v5(42.87,45.22) v5(42.87,44.47) v5(42.87,43.72) v5(43.13,41.43) v5(43.75,41.93) v5(43.93,38) v5(44.25,42.43) v5(44.75,49.04) v5(44.75,48.38) v5(44.75,47.71) v5(44.75,47.05) v5(44.75,46.38) v5(44.75,45.72) v5(44.75,45.05) v5(44.75,44.39) v5(44.75,43.72) v5(44.69,42.97) v5(47,39.98) v5(48.12,38.25)
VBAT: length 44.8
  Top Layer w0.2: v2(34.89,43.71) 34.82,43.78 33.51,43.78 R17.2 32.44,42.7 31.4,42.7 31.2,42.5 U1.72
  Top Layer w0.25: v5(61.5,30.93) 61.45,30.88 v5(55.87,30.88)
  Top Layer w0.4: v2(43.5,38.88) 43.62,39 47.75,39 v2(48.25,39.5) 48.84,40.1 49.81,40.1
  Bottom Layer w0.25: v2(34.89,43.71) 35,43.61 35,40.75 36.87,38.88 v2(43.5,38.88) ; v5(55.87,30.88) 55.87,31.88 v2(48.25,39.5)
  Bottom Layer w0.5: B1.1 62.14,30.93 v5(61.5,30.93)
VCC: length 108.1
  Top Layer w0.35: 56.47,39 56.47,40.1 ; 55.97,40.1 55.97,39 ; 56.72,39.03 U8.17 ; U8.15 55.72,39 ; U8.16 56.22,39.25
  Top Layer w0.55: 61.8,35.55 60.47,35.55 C38.2 60.47,36.5 61.8,36.5 ; 61.65,39.75 60.47,39.75 C17.2 60.47,38.8 61.65,38.8
  Top Layer w0.6: 66.25,29.25 BRAKE.3 64.7,28.75 63.45,30 54.7,30 54.57,29.88
  Top Layer w1: C36.2 56.55,34.2 C39.2 58.17,34.2 C38.2 ; 58.13,39.55 58.13,40.72 ; 58.25,39.41 58.38,39.28 C17.2 ; C18.2 56.72,39.03
  Top Layer w1.1: DEC_TMC.16 64.46,8.13 C47.1 C78.2 66.31,12.32 C83.1 C82.1 67.12,19.31 63.67,22.75 58.8,22.75 D6.1 52.3,24.75 46.69,24.75 41.12,19.18 C80.1 C81.1 40.45,12.09 C79.2 38.85,7.74 RA_TMC.16
  Top Layer w1.35: D6.1 54.57,27.03 54.57,32.94 56.22,34.59 56.22,39.25
(no net):
  vias: v1(38.09,18.66) v1(38.09,16.12) v1(63.96,17.79) v1(63.96,15.25)
D+: length 75.8
  Top Layer w0.2: 25.5,47.7 25.25,47.46 25.25,43.05 26.09,42.2 26.09,33.31 24.87,32.09 24.87,27.08 v2(23.66,25.87) 23.05,25.25 U1.3 ; 25.5,47.7 D1.6 ; 25.5,47.7 CN2.A6 25.48,49.38 v2(25.09,49.38) ; v2(25.75,51.5) 25,51.5 24.75,51.25 24.75,50.74
  Inner_1_GND w0.2: U13.2 46.26,4.27 44.34,2.35 38.64,2.35 38.22,2.77 38.22,4.15 36.39,5.98 31.27,5.98 29.12,8.13 29.12,14.75 24.12,19.75 24.12,21.75 23,22.88 23,25.63 23.24,25.87 v2(23.66,25.87)
  Bottom Layer w0.2: v2(25.09,49.38) 25.75,50.03 v2(25.75,51.5)
D-: length 72.6
  Top Layer w0.2: 24.6,46.4 24.9,46.1 24.9,42.9 25.75,42.06 25.75,33.46 24.52,32.23 24.52,27.36 23.68,26.52 v2(23.6,26.52) 23.51,26.52 22.75,25.75 U1.5 ; 24.6,46.4 24.64,46.4 24.9,46.66 24.9,48.49 24.47,48.92 24.47,49.37 CN2.A7 24.5,49.61 25.25,50.36 CN2.B7 ; 24.6,46.4 24.17,46.4
  Inner_1_GND w0.2: U13.4 47.78,6.5 33.25,6.5 31.75,8 31.75,14.88 26.62,20 26.62,22 25.12,23.5 25.12,25.27 25.64,25.8 25.64,26.21 25.35,26.5 23.62,26.5 v2(23.6,26.52)
LED: length 19.8
  Top Layer w0.2: v2(30,41.38) 29.8,41.18 29.8,40.25 29.55,40 U1.62 ; R35.1 31,51.13 31.32,50.81 34.84,50.81 v2(35.12,51.09)
  Bottom Layer w0.2: v2(35.12,51.09) 35.12,49.42 32.34,46.64 32.34,42.6 31.12,41.38 v2(30,41.38)
M1_BMA1: length 6.8
  Bottom Layer w1: 31.22,3.05 31.22,4.15 27.92,7.45 RA_TMC.12
M1_BMA2: length 6.8
  Bottom Layer w1: MOT1.4 28.69,3.44 25.38,6.74 RA_TMC.11
M1_BMB1: length 6.8
  Bottom Layer w1: RA_TMC.13 30.47,7.91 33.76,4.61 33.76,3.05
M1_BMB2: length 6.8
  Bottom Layer w1: MOT1.1 36.31,5.07 33,8.37 RA_TMC.14
M1_CS: length 24.8
  Top Layer w0.2: RA_TMC.4 30.47,22.33 v2(31.62,23.48) ; U1.55 v2(23,38.25)
  Bottom Layer w0.2: v2(31.62,23.48) 31.17,23.48 27.42,27.23 27.42,36.61 25.78,38.25 v2(23,38.25)
M1_DIR: length 26.9
  Top Layer w0.2: U1.51 v2(23,37.25)
  Bottom Layer w0.2: v2(23,37.25) 25.79,37.25 26.72,36.32 26.72,26.17 24,23.45 24,20.88 23.25,20.13 21.38,20.13 RA_TMC.8
M1_ENA: length 67.8
  Top Layer w0.2: v2(22.5,37.75) U1.53
  Top Layer w0.25: v2(65,25.38) 64.5,25.88 61.25,25.88 60.51,25.15 v2(60.51,25.07) ; v2(54.87,23.75) 54.87,23.26 53.8,22.19 52.18,22.19 51.7,22.68 v2(51.49,22.68)
  Top Layer w0.5: v2(68.05,26.25) 68.05,24.45 BRAKE.2
  Bottom Layer w0.2: 38.09,24.25 50.13,24.25 51.49,22.89 v2(51.49,22.68) ; 38.09,24.25 38,24.17 ; 38.09,24.25 33.37,24.25 ; 33.25,24.13 33.25,24.14 33.37,24.25 33.37,24.25 ; 33.25,24.13 33.24,24.13 32.1,22.98 31.14,22.98 27.07,27.05 27.07,36.47 25.79,37.75 v2(22.5,37.75) ; 33.25,24.13 33.37,24.25 ; 38,21.29 RA_TMC.1
  Bottom Layer w0.25: v2(68.05,26.25) 67.5,26.25 66.62,25.38 v2(65,25.38) ; v2(60.51,25.07) 56.19,25.07 v2(54.87,23.75)
  Bottom Layer w0.3: 38,24.17 38,21.29
M1_ENCA: length 21.9
  Top Layer w0.2: v2(23,35.25) 23,36 22.75,36.25 U1.47 ; v2(25.37,30.75) 26.51,30.75 27.5,31.75 31.63,31.75 32.71,30.67 32.71,30.41 33,30.13 35.25,30.13 R3.1
  Top Layer w0.5: R3.1 R1.2
  Bottom Layer w0.2: v2(23,35.25) 23.7,35.25 24.25,34.71 24.25,31.88 v2(25.37,30.75)
M1_ENCA_IN: length 33
  Top Layer w0.2: R1.1 38.23,32.38 39.13,31.47 39.13,26.1 39.48,25.76 41.53,25.76 43,24.29 v2(43,23.38)
  Bottom Layer w0.2: v2(43,23.38) 43,22.49 45.1,20.39 45.1,8.81 42.38,6.09 H1.3
M1_ENCB: length 19.3
  Top Layer w0.2: v2(23,34.25) 22.71,34.25 22.21,34.75 U1.41 ; R2.2 R4.1 33.5,29.25 33.32,29.43 32.7,29.43 32.01,30.12 32.01,30.38 31.34,31.05 27.79,31.05 26.5,29.75 v2(25.37,29.75)
  Bottom Layer w0.2: v2(23,34.25) 23.25,34.25 23.54,33.96 23.54,31.3 25.09,29.75 v2(25.37,29.75)
M1_ENCB_IN: length 29.2
  Top Layer w0.2: 34.75,27 34.75,26.5 35,26.25 37.5,26.25 39.05,24.7 41.01,24.7 41.5,24.22 v2(41.5,22.88)
  Bottom Layer w0.2: H1.5 41.11,6.74 44.05,9.68 44.05,19.95 41.5,22.5 v2(41.5,22.88)
M1_M4: length 23.4
  Top Layer w0.2: v2(24.5,25.75) 24.87,25.38 24.87,21.72 RA_TMC.6 ; U1.65 22.7,40.75 24,39.46 24,34.5 22.77,33.28 22.77,32.09 v2(22.62,31.94)
  Bottom Layer w0.2: v2(24.5,25.75) 24.17,26.08 24.17,29.47 22.47,31.17 22.47,31.58 22.62,31.73 v2(22.62,31.94)
M1_STEP: length 21.8
  Top Layer w0.2: U1.49 v2(22.5,36.75)
  Bottom Layer w0.2: RA_TMC.7 23.64,22 23.64,23.59 26.37,26.32 26.37,36.17 25.79,36.75 v2(22.5,36.75)
M2_BMA1: length 5.6
  Bottom Layer w1: DEC_TMC.12 53.8,6.82 56.22,4.4 MOT2.3
M2_BMA2: length 5.6
  Bottom Layer w1: DEC_TMC.11 51.26,6.24 53.69,3.81 MOT2.4
M2_BMB1: length 5.6
  Bottom Layer w1: 58.76,3.05 58.76,4.73 56.34,7.16 DEC_TMC.13
M2_BMB2: length 5.6
  Bottom Layer w1: MOT2.1 61.31,5.2 DEC_TMC.14
M2_CS: length 41.6
  Top Layer w0.2: v2(30.5,36) U1.46
  Bottom Layer w0.2: DEC_TMC.4 56.03,20.33 50.71,25.65 30.98,25.65 28.82,27.81 28.82,35.04 29.79,36 v2(30.5,36)
M2_DIR: length 46.7
  Top Layer w0.2: v2(30.5,35) U1.42 ; v2(49.87,21.88) 49.93,21.82 53.96,21.82 55.14,23 v2(55.36,23)
  Bottom Layer w0.2: v2(55.36,23) 54.87,23 51.17,26.7 31.42,26.7 29.87,28.25 29.87,33.67 30.5,34.3 v2(30.5,35) ; DEC_TMC.8 47.13,20.33 48.29,21.49 49.48,21.49 v2(49.87,21.88)
M2_ENA: length 47.1
  Top Layer w0.2: 29.99,35.5 U1.44
  Bottom Layer w0.2: v2(30,35.5) 30,35.46 29.17,34.64 29.17,27.96 31.12,26 50.85,26 55,21.85 61.65,21.85 63.17,20.33 DEC_TMC.1
M2_ENCA: length 21.9
  Top Layer w0.2: v2(23.5,35.75) 23.5,39.46 22.7,40.25 U1.63 ; R13.1 33.12,31.25 32.62,31.25 31.77,32.1 27.36,32.1 26.51,31.25 v2(25.87,31.25)
  Top Layer w0.5: R13.1 R10.2
  Bottom Layer w0.2: v2(23.5,35.75) 23.78,35.75 24.6,34.94 24.6,32.15 25.5,31.25 v2(25.87,31.25)
M2_ENCA_IN: length 40.7
  Top Layer w0.2: H1.4 42.38,3.74 42.75,3.38 44.25,3.38 44.65,3.78 44.65,7.98 44.25,8.37 v2(43.44,8.37) ; R10.1 35.5,31.63 38.48,31.63 38.78,31.33 38.78,25.96 39.34,25.4 41.3,25.4 42.5,24.21 v2(42.5,22.88)
  Bottom Layer w0.2: v2(43.44,8.37) 44.17,8.37 44.75,8.95 44.75,20.24 42.5,22.49 v2(42.5,22.88)
M2_ENCB: length 21.7
  Top Layer w0.2: R11.2 R14.1 36,28.76 35.1,29.65 33.59,29.65 33.47,29.78 32.85,29.78 32.36,30.27 32.36,30.52 31.48,31.4 27.65,31.4 26.5,30.25 v2(25.87,30.25) ; U1.43 22.29,35.25 22.79,34.75 v2(23.5,34.75)
  Bottom Layer w0.2: v2(25.87,30.25) 25.16,30.25 23.89,31.52 23.89,34.35 v2(23.5,34.75)
M2_ENCB_IN: length 33.5
  Top Layer w0.2: v2(42,23.38) 42,24.22 41.16,25.05 39.19,25.05 37.25,27 ; H1.6 41.11,3.81 41.94,2.98 44.66,2.98 45,3.31 45,8.38 44.5,8.87 v2(43.96,8.87)
  Bottom Layer w0.2: v2(42,23.38) 42,22.5 44.4,20.1 44.4,9.31 v2(43.96,8.87)
M2_M4: length 53.5
  Top Layer w0.2: v2(22.97,31.37) 23.12,31.52 23.12,33.13 24.34,34.36 24.34,39.6 22.69,41.25 U1.67 ; v2(25.14,26) 27.12,26 v2(27.25,26.13)
  Bottom Layer w0.2: v2(27.25,26.13) 27.5,26.13 31.75,21.88 31.75,20.5 32.25,20 39,20 39.5,20.5 39.5,21.59 41.81,23.9 49.98,23.9 50.99,22.89 50.99,20.6 DEC_TMC.6 ; v2(22.97,31.37) 22.97,31.16 24.52,29.61 24.52,26.63 v2(25.14,26)
M2_STEP: length 43.5
  Top Layer w0.2: DEC_TMC.7 49.7,20.33 50.84,21.47 54.1,21.47 54.99,22.35 v2(55.36,22.35) ; v2(30,34.5) U1.40
  Bottom Layer w0.2: v2(55.36,22.35) 55,22.35 51,26.35 31.27,26.35 29.52,28.1 29.52,34.03 v2(30,34.5)
MISO: length 53
  Top Layer w0.2: v2(22.5,39.75) 21.59,39.75 ; RA_TMC.5 27.92,21.31 31.6,24.98 v2(32.31,24.98)
  Bottom Layer w0.2: DEC_TMC.5 53.8,22.07 50.56,25.3 32.62,25.3 v2(32.31,24.98) 31.15,24.98 28.47,27.67 28.47,37.05 25.77,39.75 v2(22.5,39.75)
MOSI: length 63
  Top Layer w0.2: v2(23,39.25) 21.72,39.25 ; v2(31.84,24.48) 32.51,24.48 35.54,21.45 RA_TMC.2
  Bottom Layer w0.2: v2(23,39.25) 25.77,39.25 28.12,36.9 28.12,27.52 31.16,24.48 v2(31.84,24.48) 32.61,24.48 33.07,24.95 50.42,24.95 52.75,22.63 52.75,19.88 53.37,19.25 56.74,19.25 57.62,20.13 57.62,20.96 58.17,21.5 60.87,21.5 61.42,20.95 DEC_TMC.2
PPS: length 24.9
  Top Layer w0.2: v2(30.37,28.92) 30.29,29 U1.18 ; v2(42.69,33.98) 43.09,33.98 44,34.88 46.37,34.88 49.4,37.9 49.81,37.9
  Bottom Layer w0.2: v2(42.69,33.98) 42.56,34.1 38.74,34.1 35.66,31.02 32.76,31.02 30.66,28.92 v2(30.37,28.92)
PRG_ESP: length 28.3
  Top Layer w0.2: U1.60 29.62,39.5 29.89,39.77 v2(30.02,39.77)
  Bottom Layer w0.2: v2(30.02,39.77) 30.51,39.77 33.04,42.3 33.04,46.35 35.39,48.7 39.1,48.7 41.19,50.8 41.19,51.94 42.21,52.96 45.53,52.96 47.21,51.27 47.73,51.27
RST_ESP: length 32.4
  Top Layer w0.2: U1.58 29.75,39 29.86,39.12 v2(30,39.12)
  Bottom Layer w0.2: H2.4 49.89,51.27 48.61,49.99 47.03,49.99 46.37,50.65 46.37,51.62 45.38,52.61 42.36,52.61 41.54,51.8 41.54,50.63 39.26,48.35 35.54,48.35 33.4,46.21 33.4,42.16 30.36,39.12 v2(30,39.12)
RX_DEBUG: length 34.5
  Top Layer w0.2: U1.56 29.9,38.5 v2(30.02,38.38)
  Bottom Layer w0.2: v2(30.02,38.38) 30.11,38.38 33.75,42.01 33.75,46.06 35.68,48 39.41,48 41.89,50.49 41.89,51.65 42.5,52.26 45.24,52.26 46.02,51.47 46.02,50.44 46.5,49.97 46.5,48.17 47.16,47.5 49,47.5 50.27,46.23 H2.8
RX_GPS: length 29.4
  Top Layer w0.2: 49.81,35.58 48.06,35.58 46.66,34.18 44.29,34.18 43.24,33.13 42.34,33.13 41.84,33.63 41.84,34.36 42.69,35.21 43.22,35.21 v2(43.42,35.01) ; U1.20 30.31,29.5 v2(30.37,29.57)
  Bottom Layer w0.2: v2(30.37,29.57) 30.37,30.11 31.99,31.72 35.37,31.72 38.45,34.8 42.01,34.8 42.46,35.25 43.18,35.25 v2(43.42,35.01)
RX_REMOTE: length 14.7
  Top Layer w0.2: 29.45,46.73 30.02,46.73 v2(30.25,46.5) 30.25,45.73 R8.2 ; CN1.2 33.27,54.88 v2(34.84,54.88)
  Bottom Layer w0.2: v2(30.25,46.5) 29.9,46.85 29.9,47.49 30.41,48 31.45,48 33.19,49.75 33.19,53.24 v2(34.84,54.88)
SCK: length 57.1
  Top Layer w0.2: v2(32.22,23.94) 32.43,23.94 33,23.37 RA_TMC.3 ; v2(22.5,38.75) 21.46,38.75
  Bottom Layer w0.2: v2(22.5,38.75) 25.77,38.75 27.77,36.76 27.77,27.37 31.16,23.98 32.18,23.98 v2(32.22,23.94) 32.56,23.94 33.22,24.6 50.27,24.6 52.37,22.51 52.37,19.76 53.23,18.9 56.89,18.9 58.31,20.33 DEC_TMC.3
SCL: length 22.3
  Top Layer w0.2: v2(31.37,28.88) 30.95,28.46 30.77,28.46 30.31,28 U1.14
  Top Layer w0.25: v2(39,33.6) 38.75,33.85 38.75,35.75 38,36.49 36.07,36.49 35.63,36.05 35.63,35.49 34.81,34.67 33.75,34.67 33.31,34.23 R41.1
  Bottom Layer w0.2: v2(39,33.6) 38.73,33.6 35.8,30.67 32.9,30.67 31.37,29.14 v2(31.37,28.88)
SCLG: length 7.1
  Top Layer w0.2: U3.17 40.82,35.7 41.25,36.13 44.25,36.13 45.37,37.25 v1(46.62,37.25)
SDA: length 17.9
  Top Layer w0.2: R40.2 37.89,33.88 v2(38.82,32.95) ; v2(32.16,29.19) 32.16,28.79 31.48,28.11 30.92,28.11 30.31,27.5 U1.12
  Top Layer w0.25: R40.2 36.3,34.88 36.65,35.22 37.51,35.22
  Bottom Layer w0.2: v2(32.16,29.19) 32.16,29.43 33.05,30.32 35.95,30.32 38.58,32.95 v2(38.82,32.95)
SDAG: length 2.7
  Top Layer w0.2: v1(42.62,37.25) 42.17,36.8 U3.16
TX_DEBUG: length 30.7
  Top Layer w0.2: v2(30.32,40.79) 30.52,40.59 30.52,38.17 30.15,37.8 29.82,37.8 29.62,38 U1.54
  Bottom Layer w0.2: 47.73,53.81 47.73,53.51 47.53,53.31 42.07,53.31 40.84,52.09 40.84,50.95 38.95,49.05 35.25,49.05 32.69,46.5 32.69,42.45 31.03,40.79 v2(30.32,40.79)
TX_GPS: length 26.7
  Top Layer w0.2: 49.81,36.8 48.79,36.8 46.51,34.53 44.15,34.53 43.09,33.48 42.48,33.48 42.19,33.77 42.19,34.22 42.6,34.63 v2(42.88,34.63) ; U1.22 28.83,30.07 30.85,30.07 v2(30.94,29.97)
  Bottom Layer w0.2: v2(30.94,29.97) 30.94,30.18 32.13,31.37 35.51,31.37 38.59,34.45 42.15,34.45 42.33,34.63 v2(42.88,34.63)
TX_REMOTE: length 13.7
  Top Layer w0.2: CN1.3 32.69,52.41 v2(32.69,52.9) ; v2(31.25,48.5) 31.25,48.06 ; 30.5,44.54 30.79,44.54 v2(31,44.75) 31.2,44.54 31.5,44.54
  Bottom Layer w0.2: v2(31,44.75) 31,45.05 29.55,46.5 29.55,47.64 30.41,48.5 v2(31.25,48.5) 31.46,48.5 32.84,49.89 32.84,52.75 v2(32.69,52.9)
VUSB_IN: length 89.4
  Top Layer w0.2: 23.53,47 23.5,47.04 CN2.A9 ; 23.53,47 24.29,47 ; 23.53,47 v2(23.5,47) ; 23.53,47 23.53,46.14 24.55,45.11 24.55,42.76 25.39,41.91 25.39,33.6 24.17,32.38 24.17,27.68 23.71,27.22 v2(23.67,27.22) 23.62,27.17 23.5,27.17 23.08,26.75 U1.9 ; v2(26.75,47) 26.06,47 D1.5 ; CN2.B4 23.75,51.8 23.94,52 26.05,52 26.25,51.8 CN2.B9 26.25,50.22 26.5,49.97 CN2.A4 ; CN2.A9 23.47,49.37 ; CN2.A9 23.5,49.97 23.75,50.22 23.75,50.74
  Inner_1_GND w0.2: v2(23.67,27.22) 23.63,27.25 22.5,27.25 21.62,26.38 21.62,19.13 26.75,14 26.75,7.63 28.75,5.63 36.25,5.63 37.87,4 37.87,2.63 38.5,2 44.49,2 45.37,2.88 46.99,2.88 47,2.88 47.95,2.88 47.96,2.88 48.87,2.88 U13.3
  Bottom Layer w0.2: v2(26.75,47) v2(23.5,47)
$1N74185: length 22.8
  Top Layer w0.2: v2(29.5,44.75) 29.5,45.5 29.53,45.54 R8.1 ; U1.19 22.62,29.25 23.47,30.1 23.47,32.67 24.69,33.89 24.69,41.2 24.14,41.75 v2(24.14,42.45)
  Bottom Layer w0.2: v2(29.5,44.75) 27.19,42.45 v2(24.14,42.45)
$1N74186: length 22.7
  Top Layer w0.2: v2(29.58,44.08) 29.98,43.68 R7.1 ; v2(24.64,41.95) 25.05,41.55 25.05,33.75 23.82,32.52 23.82,29.95 22.62,28.75 U1.17
  Bottom Layer w0.2: v2(29.58,44.08) 29.32,44.08 27.34,42.1 24.79,42.1 v2(24.64,41.95)
$1N92540: length 2.7
  Top Layer w0.25: L1.1 38.37,40 39.37,39 U3.14
$1N104745: length 5.1
  Top Layer w0.2: CN2.B5 v2(24.25,51.5)
  Top Layer w0.5: v2(22.75,48.38) R5.2
  Bottom Layer w0.2: v2(22.75,48.38) 22.75,50 v2(24.25,51.5)
$1N104749: length 2.9
  Top Layer w0.2: CN2.A5 26,48.99 26.24,48.74 26.94,48.74 27.93,47.76 R9.1
$1N106279: length 1.2
  Top Layer w0.2: LED2.2 31,54.45 R35.2
$1N106286: length 1.7
  Top Layer w0.2: LED1.2 R12.1
$1N143386: length 11.9
  Top Layer w0.25: L1.2 38.72,42.3 U3.11
  Top Layer w1: JP1.1 43.79,49.23 43.79,43.3 42.79,42.3 40.18,42.3
$1N173382: length 13.6
  Top Layer w0.25: 37.22,39.03 37.51,39.03 ; 37.22,39.03 35.97,39.03 v2(35.44,38.5) ; 37.22,39.03 37.22,39.6 C84.1 36.37,40.8 36.37,43.32 ; v2(36.2,35.81) 36.2,35.45 35.4,34.65 35.4,33.92 R40.1 R41.2
  Bottom Layer w0.25: v2(36.2,35.81) 36.2,37.74 v2(35.44,38.5)
$3N2384: length 1.6
  Top Layer w0.2: D3.1 33.37,42.04 R17.1
$3N2780: length 4.4
  Top Layer w0.5: 64.34,39.75 65.52,39.75 C13.2 67.22,38.05 L2.1
$3N23825: length 1.3
  Top Layer w0.5: 64.34,40.7 65.47,40.7 C13.1
$3N39858: length 17.3
  Top Layer w0.2: v2(55,44.75) 55,46.32 55.94,47.25 57.19,47.25 57.96,48.03 68.06,48.03 PS1.5
  Top Layer w0.25: R18.2 v2(55,44.75) 55,44.5 55.17,44.33 U8.4
$3N39869: length 23.6
  Top Layer w0.35: U8.3 55.72,44.7 57.15,46.13 ; 57.75,45.83 57.75,46 57.62,46.13 ; 57.2,45.28 56.22,44.3 U8.1 ; 57.2,45.28 56.77,45.28 55.97,44.48 55.97,43.9 ; 57.2,45.28 57.4,45.48 57.6,45.78 DC1.1 ; 56.47,43.9 56.47,44.12 57.85,45.5 57.85,45.03 U8.1
  Top Layer w0.5: PS1.4 67.29,46.63 65.59,46.63 IN1.2
  Top Layer w1.8: DC1.1 57.75,46 58.52,46.78 IN1.2
$3N39927: length 2.5
  Top Layer w0.5: 65.7,55.83 PS1.1
$3N39977: length 1.2
  Top Layer w0.3: U8.7 52.83,43 C30.2
$3N40219: length 1.9
  Top Layer w0.25: R32.2 55.17,39.18 U8.14
$3N40264: length 2.6
  Top Layer w0.3: U8.12 53.82,39.75 52.29,39.75 52,39.45 C33.1
$3N40420: length 2.2
  Top Layer w0.25: U8.13 54.67,39.68 54.25,39.25 53.42,39.25 R31.2
$3N44061: length 3.9
  Top Layer w0.5: L3.1 67.75,36.46 C37.2 65.45,36.5 64.19,36.5
$3N44065: length 1.3
  Top Layer w0.5: C37.1 65.4,37.45 64.19,37.45

## Copper pours and planes (outline as drawn; the poured copper is in the pictures)
+3.3V on Top Layer: 69.5,35.25 69.5,32.75 65.75,32.75 65.75,34.75 66.25,34.75 66.25,35.25
+5V on Top Layer: 66.29,41.95 69.5,41.95 69.5,39.5 66.29,39.5
GND on Top Layer: 0,0 0,44.01 10.5,44.01 10.5,57 104,57 104,37.51 82.5,37.51 82.5,9.01 79,9.01 79,0
GND on Bottom Layer: 0,0 0,44.01 10.5,44.01 10.5,57 104,57 104,37.51 82.5,37.51 82.5,9.01 79,9.01 79,0
GND on Inner_1_GND: 0,0 0,44.01 10.5,44.01 10.5,57 104,57 104,37.51 82.5,37.51 82.5,9.01 79,9.01 79,0
GND on Inner_2_GND: 0,0 0,44.01 10.5,44.01 10.5,57 104,57 104,37.51 82.5,37.51 82.5,9.01 79,9.01 79,0

## Text on the board
Bottom Silkscreen Layer: VIN | 3.3V | GND | /EN | GitHub/HEMY-02/25 | JLCJLCJLCJLC | G | K | R | B | Rechargeable / only | 5V | A | - + | 1B | 1A | RA / AZ | 2A | 2B | DEC / ALT | groups.io/g/teenastro | Enc AZ / Enc ALT | BRAKE | +  - | Project Wiki | v2.6.5M | USB | SHC | 12V 3A | TeenAstro / Redux | by zUrp | -TEENSY- | SDA.GPS | SCL.GPS | -DEBUG- | -GPS- | 3.3V ->
Top Silkscreen Layer: - + | RA | DEC
